# Altium schematic sheet 电磁线圈.SchDoc
size 457 x 254 mm
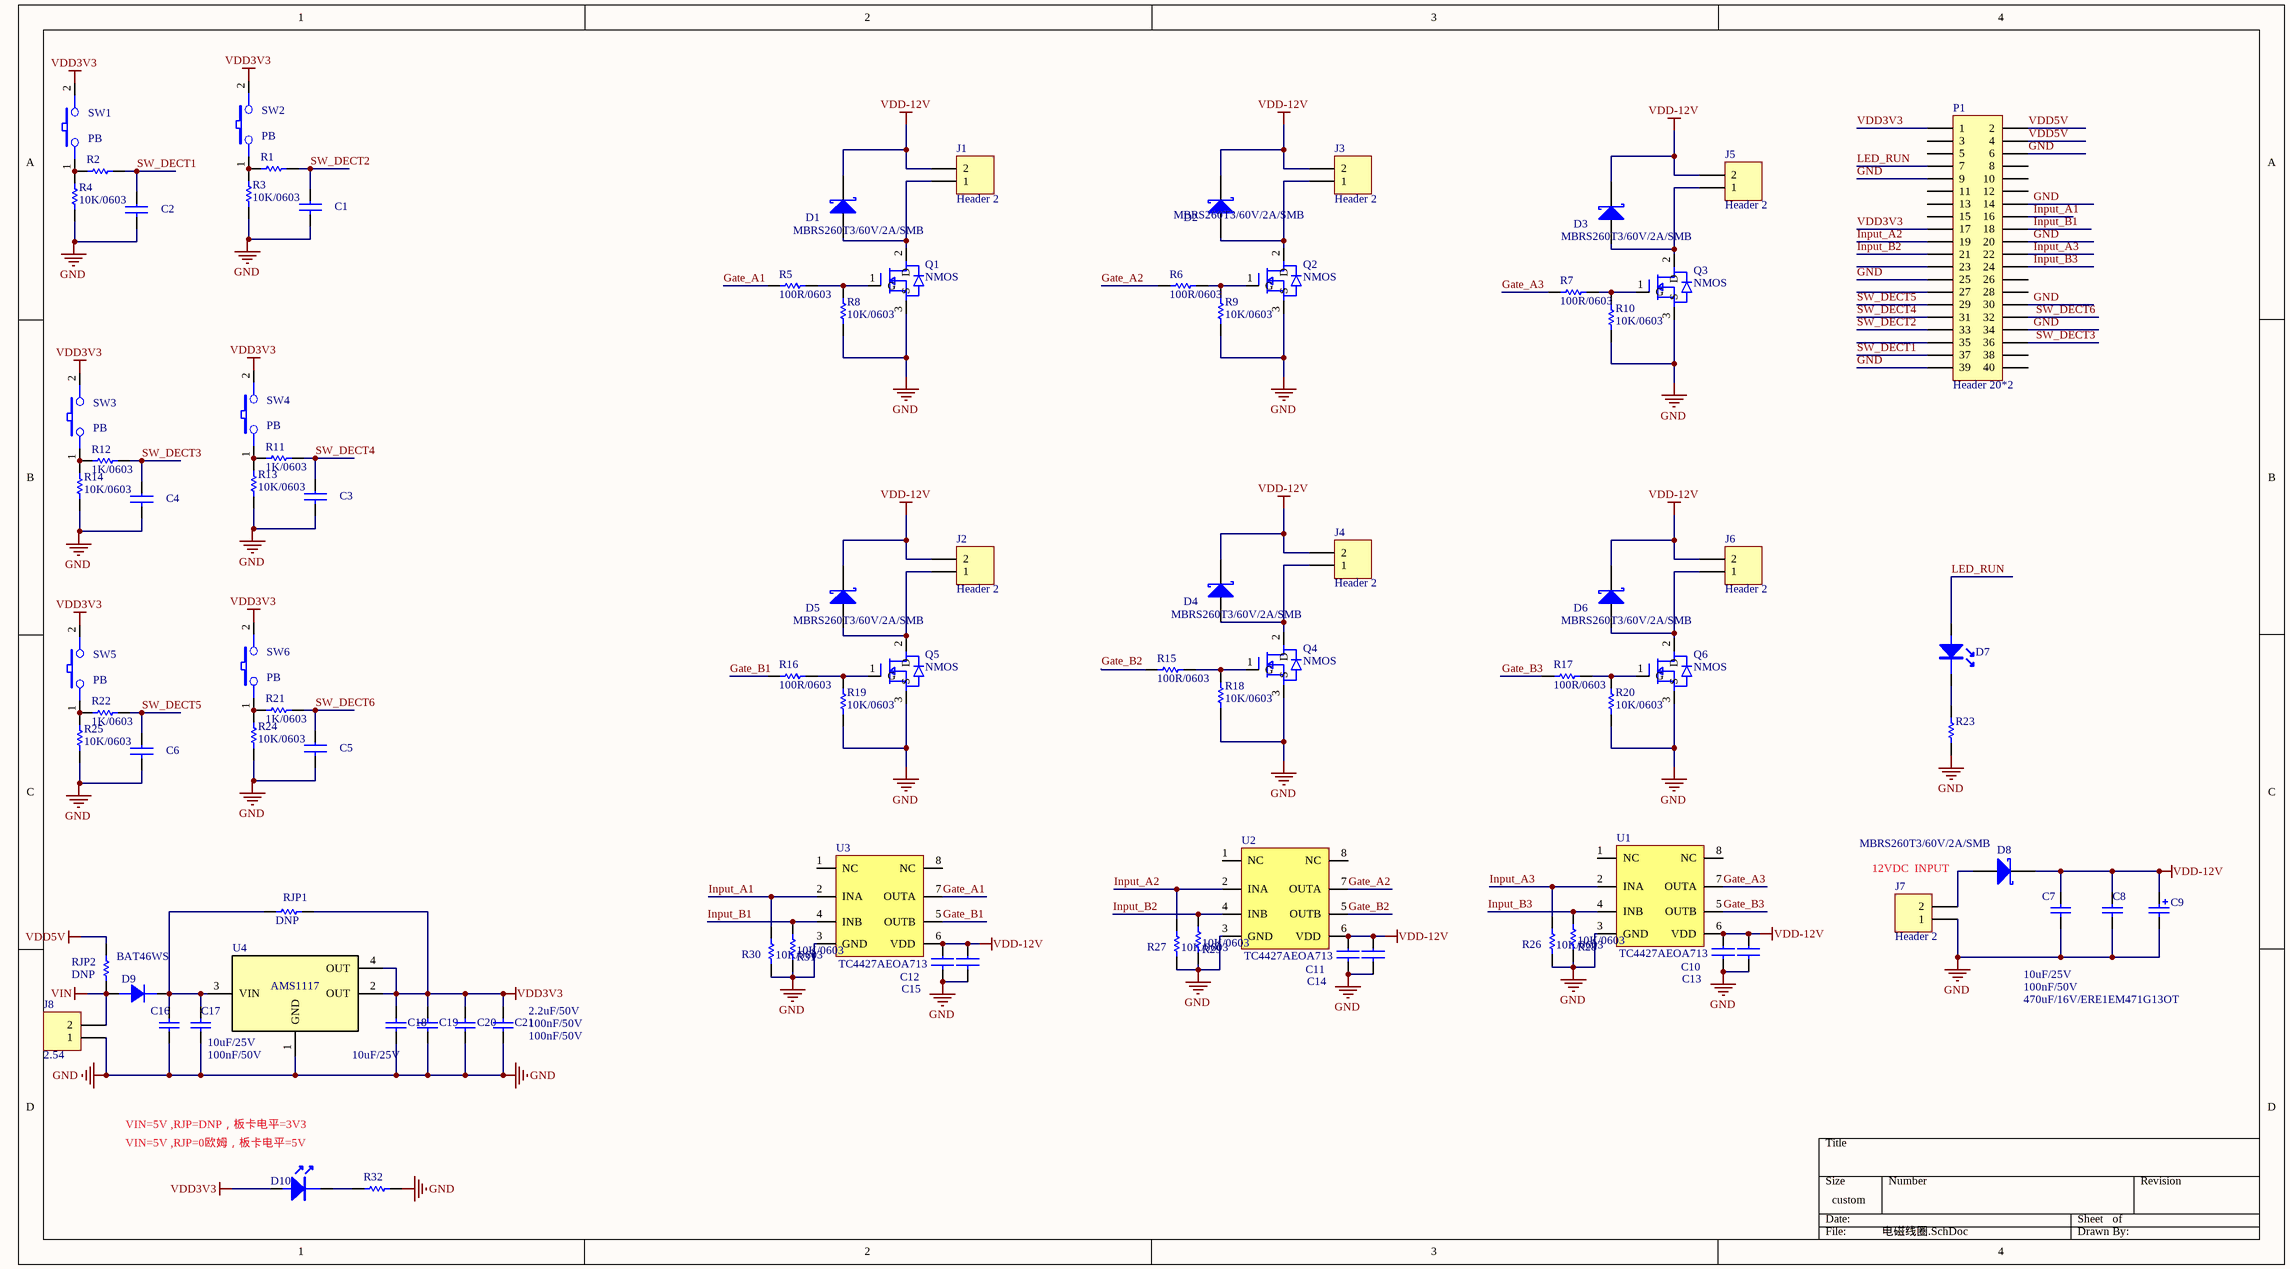
[diagram p0: 电磁线圈.SchDoc]

## Parts
C1  100nF/0603/100V  [C0603]  (value not drawn)
C2  100nF/0603/100V  [C0603]  (value not drawn)
C3  100nF/0603/100V  [C0603]  (value not drawn)
C4  100nF/0603/100V  [C0603]  (value not drawn)
C5  100nF/0603/100V  [C0603]  (value not drawn)
C6  100nF/0603/100V  [C0603]  (value not drawn)
C7  10uF/25V  [C0805]
C8  100nF/50V  [C0805]
C9  470uF/16V/ERE1EM471G13OT  [EC5X12.5X20V]
C10  10uF/25V  [C0805]  (value not drawn)
C11  10uF/25V  [C0805]  (value not drawn)
C12  10uF/25V  [C0805]  (value not drawn)
C13  100nF/0603/100V  [C0603]  (value not drawn)
C14  100nF/0603/100V  [C0603]  (value not drawn)
C15  100nF/0603/100V  [C0603]  (value not drawn)
C16  10uF/25V  [C0805]
C17  100nF/50V  [C0603]
C18  10uF/25V  [C0805]
C19  2.2uF/50V  [C0603]
C20  100nF/50V  [C0603]
C21  100nF/50V  [C0603]
D1  MBRS260T3/60V/2A/SMB  [SMA]
D2  MBRS260T3/60V/2A/SMB  [SMA]
D3  MBRS260T3/60V/2A/SMB  [SMA]
D4  MBRS260T3/60V/2A/SMB  [SMA]
D5  MBRS260T3/60V/2A/SMB  [SMA]
D6  MBRS260T3/60V/2A/SMB  [SMA]
D7  (no value)  [D0603]
D8  MBRS260T3/60V/2A/SMB  [SMA]
D9  BAT46WS  [SOD-323]
D10  (no value)  [D0603]
J1  Header 2  [XH-2.54-2P]
J2  Header 2  [XH-2.54-2P]
J3  Header 2  [XH-2.54-2P]
J4  Header 2  [XH-2.54-2P]
J5  Header 2  [XH-2.54-2P]
J6  Header 2  [XH-2.54-2P]
J7  Header 2  [XH-2.54-2P]
J8  2.54
P1  Header 20*2  [HDR2X20]
Q1  NMOS  [TO-252]
Q2  NMOS  [TO-252]
Q3  NMOS  [TO-252]
Q4  NMOS  [TO-252]
Q5  NMOS  [TO-252]
Q6  NMOS  [TO-252]
R1  (no value)  [R0603]
R2  (no value)  [R0603]
R3  10K/0603  [R0603]
R4  10K/0603  [R0603]
R5  100R/0603  [R0603]
R6  100R/0603  [R0603]
R7  100R/0603  [R0603]
R8  10K/0603  [R0603]
R9  10K/0603  [R0603]
R10  10K/0603  [R0603]
R11  1K/0603  [R0603]
R12  1K/0603  [R0603]
R13  10K/0603  [R0603]
R14  10K/0603  [R0603]
R15  100R/0603  [R0603]
R16  100R/0603  [R0603]
R17  100R/0603  [R0603]
R18  10K/0603  [R0603]
R19  10K/0603  [R0603]
R20  10K/0603  [R0603]
R21  1K/0603  [R0603]
R22  1K/0603  [R0603]
R23  (no value)  [R0603]
R24  10K/0603  [R0603]
R25  10K/0603  [R0603]
R26  10K/0603  [R0603]
R27  10K/0603  [R0603]
R28  10K/0603  [R0603]
R29  10K/0603  [R0603]
R30  10K/0603  [R0603]
R31  10K/0603  [R0603]
R32  (no value)  [R0603]
RJP1  DNP  [R0603]
RJP2  DNP  [R0603]
SW1  PB  [TS-1101-C-W]
SW2  PB  [TS-1101-C-W]
SW3  PB  [TS-1101-C-W]
SW4  PB  [TS-1101-C-W]
SW5  PB  [TS-1101-C-W]
SW6  PB  [TS-1101-C-W]
U1  TC4427AEOA713  [SOIC-8]
U2  TC4427AEOA713  [SOIC-8]
U3  TC4427AEOA713  [SOIC-8]
U4  AMS1117  [SOT-223]

## Nets
GND: C1.2 C2.2 C3.2 C4.2 C5.2 C6.2 C7.2 C8.2 C9.2 C10.2 C11.2 C12.2 C13.2 C14.2 C15.2 C16.2 C17.2 C18.2 C19.2 C20.2 C21.2 J7.1 J8.1 P1.6 P1.9 P1.14 P1.20 P1.25 P1.30 P1.34 P1.39 Q1.3(S) Q2.3(S) Q3.3(S) Q4.3(S) Q5.3(S) Q6.3(S) R3.2 R4.2 R8.2 R9.2 R10.2 R13.2 R14.2 R18.2 R19.2 R20.2 R23.2 R24.2 R25.2 R26.1 R27.1 R28.2 R29.2 R30.1 R31.2 R32.2 U1.3(GND) U2.3(GND) U3.3(GND) U4.1(GND)
VDD3V3: C18.1 C19.1 C20.1 C21.1 D10.A P1.1 P1.17 RJP1.2 SW1.2 SW2.2 SW3.2 SW4.2 SW5.2 SW6.2 U4.2(OUT) U4.4(OUT)
VDD5V: P1.2 P1.4 RJP2.2
VDD-12V: C7.1 C8.1 C9.1 C10.1 C11.1 C12.1 C13.1 C14.1 C15.1 D1.2(K) D2.2(K) D3.2(K) D4.2(K) D5.2(K) D6.2(K) D8.2(K) J1.2 J2.2 J3.2 J4.2 J5.2 J6.2 U1.6(VDD) U2.6(VDD) U3.6(VDD)
VIN: D9.1(A) J8.2 RJP2.1
Gate_A1: R5.1 U3.7(OUTA)
Gate_A2: R6.1 U2.7(OUTA)
Gate_A3: R7.1 U1.7(OUTA)
Gate_B1: R16.1 U3.5(OUTB)
Gate_B2: R15.1 U2.5(OUTB)
Gate_B3: R17.1 U1.5(OUTB)
Input_A1: P1.16 R30.2 U3.2(INA)
Input_A2: P1.19 R27.2 U2.2(INA)
Input_A3: P1.22 R26.2 U1.2(INA)
Input_B1: P1.18 R31.1 U3.4(INB)
Input_B2: P1.21 R29.1 U2.4(INB)
Input_B3: P1.24 R28.1 U1.4(INB)
LED_RUN: D7.A P1.7
SW_DECT1: C2.1 P1.37 R2.2
SW_DECT2: C1.1 P1.33 R1.2
SW_DECT3: C4.1 P1.36 R12.2
SW_DECT4: C3.1 P1.31 R11.2
SW_DECT5: C6.1 P1.29 R22.2
SW_DECT6: C5.1 P1.32 R21.2
NetC16_1: C16.1 C17.1 D9.2(K) RJP1.1 U4.3(VIN)
NetD1_1: D1.1(A) J1.1 Q1.2(D)
NetD2_1: D2.1(A) J3.1 Q2.2(D)
NetD3_1: D3.1(A) J5.1 Q3.2(D)
NetD4_1: D4.1(A) J4.1 Q4.2(D)
NetD5_1: D5.1(A) J2.1 Q5.2(D)
NetD6_1: D6.1(A) J6.1 Q6.2(D)
NetD7_K: D7.K R23.1
NetD8_1: D8.1(A) J7.2
NetD10_K: D10.K R32.1
NetQ1_1: Q1.1(G) R5.2 R8.1
NetQ2_1: Q2.1(G) R6.2 R9.1
NetQ3_1: Q3.1(G) R7.2 R10.1
NetQ4_1: Q4.1(G) R15.2 R18.1
NetQ5_1: Q5.1(G) R16.2 R19.1
NetQ6_1: Q6.1(G) R17.2 R20.1
NetR1_1: R1.1 R3.1 SW2.1
NetR2_1: R2.1 R4.1 SW1.1
NetR11_1: R11.1 R13.1 SW4.1
NetR12_1: R12.1 R14.1 SW3.1
NetR21_1: R21.1 R24.1 SW6.1
NetR22_1: R22.1 R25.1 SW5.1

Not connected (* = marked no-connect by the designer): P1 3 5 8 10 11 12 13 15 23 26 27 28 35 38 40; U1 1(NC) 8(NC); U2 1(NC) 8(NC); U3 1(NC) 8(NC)

## Notes on the sheet
- (near J7) 12VDC  INPUT
- VIN=5V ,RJP=DNP，板卡电平=3V3
- (near D10) VIN=5V ,RJP=0欧姆，板卡电平=5V

## Library data of the parts
C1-C6 C13-C15 = CAP CER 100nF 10% 50V 0603 X7R: C408909; LiChuang: C30926; Assembly: SMT; PCB Footprint: C0603S
C7 C8 C16-C21 = Cap
C9 = Cap Pol3: C105289; Value: 47uF/35V/35YXM47MEFR6.3X11
C10-C12 = CAP CER 100nF 10% 50V 0603 X7R
D1-D6 D8 = Diode Schottky
D7 D10 = LED
D9 = Diode_75V_150mA_1N4148WS: C2991954
J1-J8 = Header 2: Header, 2-Pin
P1 = Header 18X2_1: Header, 18-Pin, Dual row
Q1-Q6 = NMOS: NCE6020AK
R1-R32 RJP1 RJP2 = RES2
SW1-SW6 = PushButton_TS-1101-C-W: C318938
U1-U3 = UCC37324